# Altium schematic sheet minimal.SchDoc
size A4
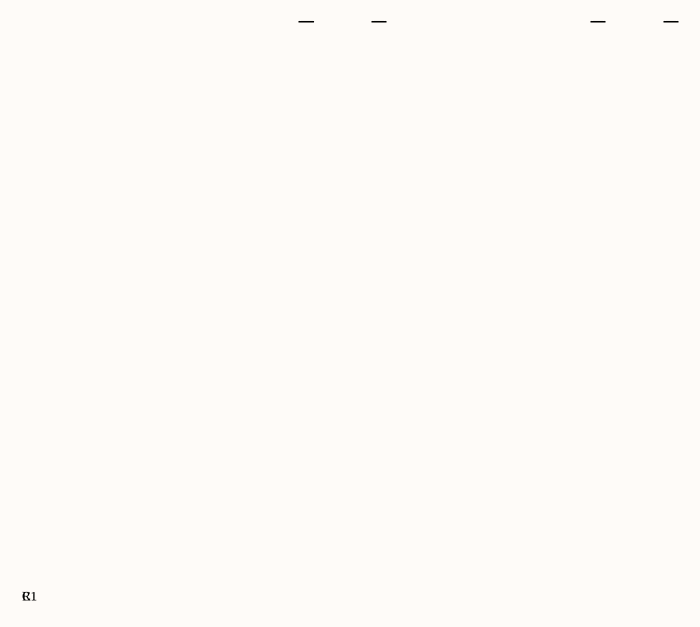
[diagram p0: minimal.SchDoc]

## Parts
C1  (no value)
R1  (no value)

## Nets

Not connected (* = marked no-connect by the designer): C1 1 2; R1 1 2

## Library data of the parts
C1 = Capacitor
R1 = Resistor